# EAGLE design EPGcontrolUniDAC-ClaudeCode (EAGLE 7.7.0)
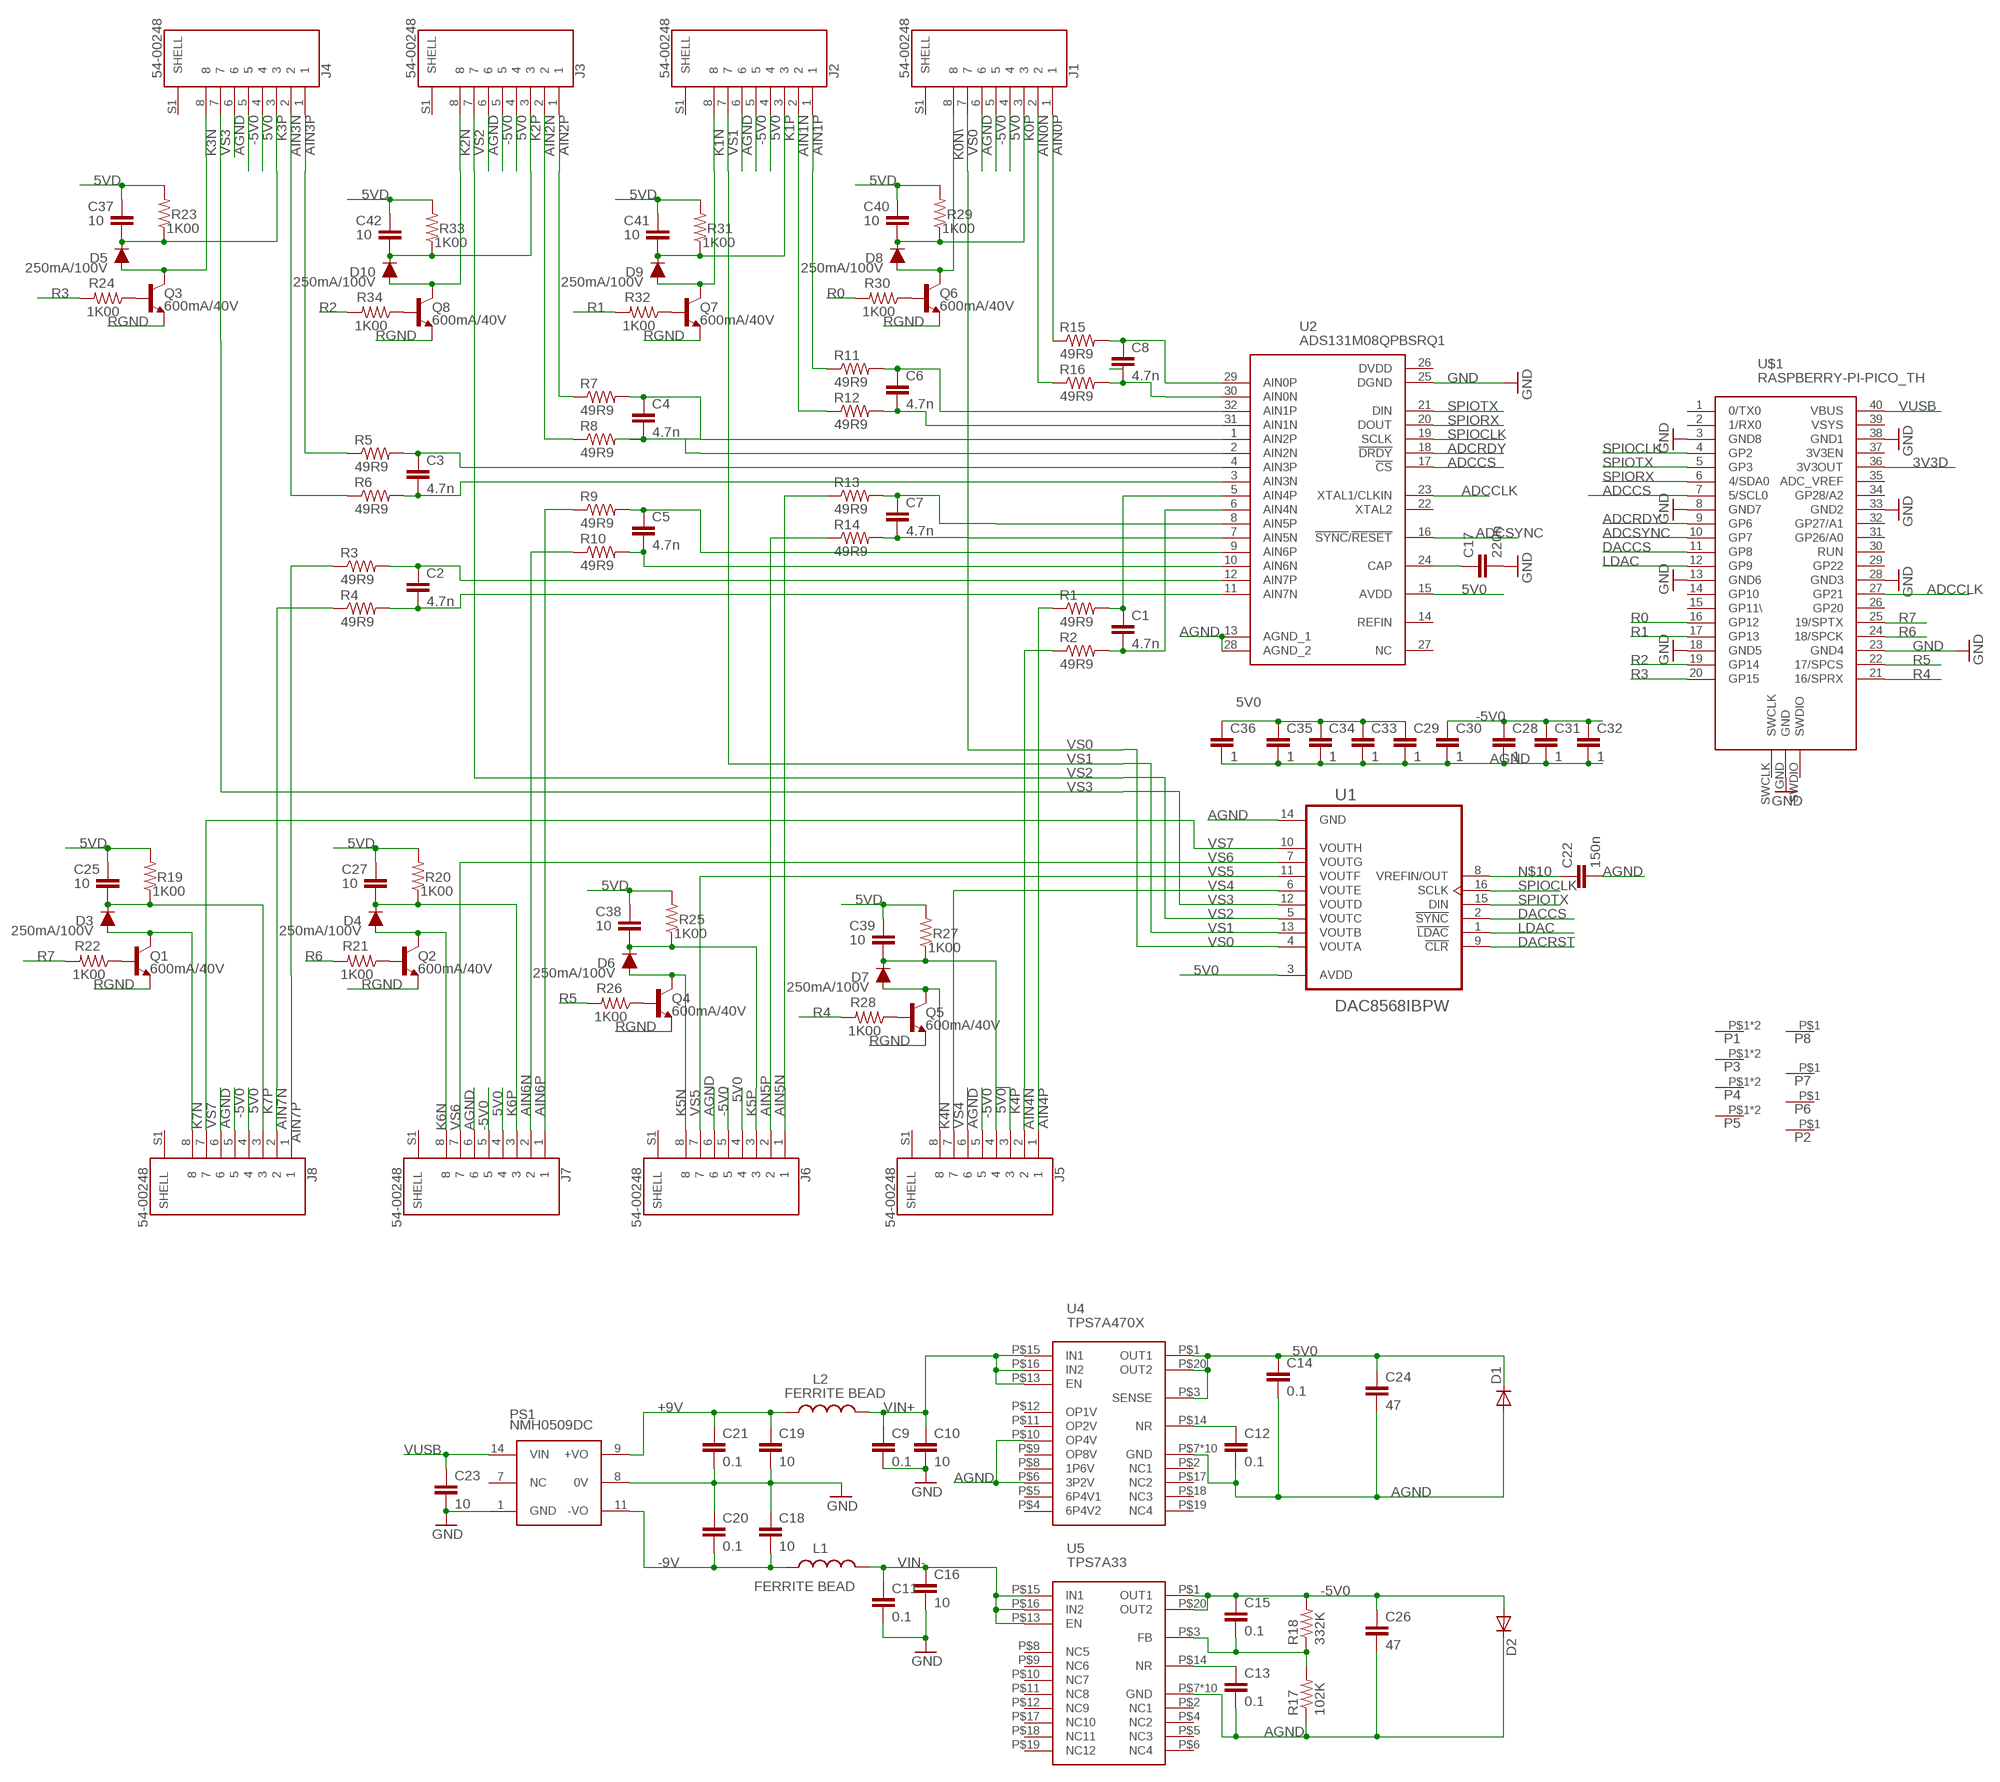
[diagram p0: schematic, sheet 1]

## Parts
C1  4.7n  CAPS0603S  [0603S]
C2  4.7n  CAPS0603S  [0603S]
C3  4.7n  CAPS0603S  [0603S]
C4  4.7n  CAPS0603S  [0603S]
C5  4.7n  CAPS0603S  [0603S]
C6  4.7n  CAPS0603S  [0603S]
C7  4.7n  CAPS0603S  [0603S]
C8  4.7n  CAPS0603S  [0603S]
C9  0.1  CAPS0603S  [0603S]
C10  10  C-EUC1206  [C1206]
C11  0.1  CAPS0603S  [0603S]
C12  0.1  CAPS0603S  [0603S]
C13  0.1  CAPS0603S  [0603S]
C14  0.1  CAPS0603S  [0603S]
C15  0.1  CAPS0603S  [0603S]
C16  10  C-EUC1206  [C1206]
C17  220n  CAPS0603S  [0603S]
C18  10  C-EUC1206  [C1206]
C19  10  C-EUC1206  [C1206]
C20  0.1  CAPS0603S  [0603S]
C21  0.1  CAPS0603S  [0603S]
C22  150n  CAPS0603S  [0603S]
C23  10  C-EUC1206  [C1206]
C24  47  C-EUC1206  [C1206]
C25  10  CAPS1206S  [1206S]
C26  47  C-EUC1206  [C1206]
C27  10  CAPS1206S  [1206S]
C28  1  CAPS0805S  [0805S]
C29  1  CAPS0805S  [0805S]
C30  1  CAPS0805S  [0805S]
C31  1  CAPS0805S  [0805S]
C32  1  CAPS0805S  [0805S]
C33  1  CAPS0805S  [0805S]
C34  1  CAPS0805S  [0805S]
C35  1  CAPS0805S  [0805S]
C36  1  CAPS0805S  [0805S]
C37  10  CAPS1206S  [1206S]
C38  10  CAPS1206S  [1206S]
C39  10  CAPS1206S  [1206S]
C40  10  CAPS1206S  [1206S]
C41  10  CAPS1206S  [1206S]
C42  10  CAPS1206S  [1206S]
D1  DIODESMA  [SMA-DIODE]
D2  DIODESMA  [SMA-DIODE]
D3  250mA/100V  DIODE-BAS16J  [SOD-323]
D4  250mA/100V  DIODE-BAS16J  [SOD-323]
D5  250mA/100V  DIODE-BAS16J  [SOD-323]
D6  250mA/100V  DIODE-BAS16J  [SOD-323]
D7  250mA/100V  DIODE-BAS16J  [SOD-323]
D8  250mA/100V  DIODE-BAS16J  [SOD-323]
D9  250mA/100V  DIODE-BAS16J  [SOD-323]
D10  250mA/100V  DIODE-BAS16J  [SOD-323]
J1  54-00248  [TENSILITY_54-00248]
J2  54-00248  [TENSILITY_54-00248]
J3  54-00248  [TENSILITY_54-00248]
J4  54-00248  [TENSILITY_54-00248]
J5  54-00248  [TENSILITY_54-00248]
J6  54-00248  [TENSILITY_54-00248]
J7  54-00248  [TENSILITY_54-00248]
J8  54-00248  [TENSILITY_54-00248]
L1  FERRITE BEAD  INDUCTOR_SM0805S  [0805S]
L2  FERRITE BEAD  INDUCTOR_SM0805S  [0805S]
P1  CON1BANANA  [BANANA_105-0754-001]
P2  CON1574  [574]
P3  CON1BANANA  [BANANA_105-0754-001]
P4  CON1BANANA  [BANANA_105-0754-001]
P5  CON1BANANA  [BANANA_105-0754-001]
P6  CON1574  [574]
P7  CON1574  [574]
P8  CON1574  [574]
PS1  NMH0509DC  DC-DC-PDS1-DUALPDM2  [PDM2]
Q1  600mA/40V  TRANS_NPN-MMBT2222AL  [SOT23-3]
Q2  600mA/40V  TRANS_NPN-MMBT2222AL  [SOT23-3]
Q3  600mA/40V  TRANS_NPN-MMBT2222AL  [SOT23-3]
Q4  600mA/40V  TRANS_NPN-MMBT2222AL  [SOT23-3]
Q5  600mA/40V  TRANS_NPN-MMBT2222AL  [SOT23-3]
Q6  600mA/40V  TRANS_NPN-MMBT2222AL  [SOT23-3]
Q7  600mA/40V  TRANS_NPN-MMBT2222AL  [SOT23-3]
Q8  600mA/40V  TRANS_NPN-MMBT2222AL  [SOT23-3]
R1  49R9  RESISTOR_SM0805S  [0805S]
R2  49R9  RESISTOR_SM0805S  [0805S]
R3  49R9  RESISTOR_SM0805S  [0805S]
R4  49R9  RESISTOR_SM0805S  [0805S]
R5  49R9  RESISTOR_SM0805S  [0805S]
R6  49R9  RESISTOR_SM0805S  [0805S]
R7  49R9  RESISTOR_SM0805S  [0805S]
R8  49R9  RESISTOR_SM0805S  [0805S]
R9  49R9  RESISTOR_SM0805S  [0805S]
R10  49R9  RESISTOR_SM0805S  [0805S]
R11  49R9  RESISTOR_SM0805S  [0805S]
R12  49R9  RESISTOR_SM0805S  [0805S]
R13  49R9  RESISTOR_SM0805S  [0805S]
R14  49R9  RESISTOR_SM0805S  [0805S]
R15  49R9  RESISTOR_SM0805S  [0805S]
R16  49R9  RESISTOR_SM0805S  [0805S]
R17  102K  R-US_R0805  [R0805]
R18  332K  R-US_R0805  [R0805]
R19  1K00  RESISTOR_SM0805S  [0805S]
R20  1K00  RESISTOR_SM0805S  [0805S]
R21  1K00  RESISTOR_SM0805S  [0805S]
R22  1K00  RESISTOR_SM0805S  [0805S]
R23  1K00  RESISTOR_SM0805S  [0805S]
R24  1K00  RESISTOR_SM0805S  [0805S]
R25  1K00  RESISTOR_SM0805S  [0805S]
R26  1K00  RESISTOR_SM0805S  [0805S]
R27  1K00  RESISTOR_SM0805S  [0805S]
R28  1K00  RESISTOR_SM0805S  [0805S]
R29  1K00  RESISTOR_SM0805S  [0805S]
R30  1K00  RESISTOR_SM0805S  [0805S]
R31  1K00  RESISTOR_SM0805S  [0805S]
R32  1K00  RESISTOR_SM0805S  [0805S]
R33  1K00  RESISTOR_SM0805S  [0805S]
R34  1K00  RESISTOR_SM0805S  [0805S]
U1  DAC8568IBPW  [SOP65P640X120-16N]
U2  ADS131M08QPBSRQ1  [QFP50P700X700X120-32N]
U4  TPS7A470X  [VQFN-20-5X5]
U5  TPS7A33  [VQFN-20-5X5]
U$1  RASPBERRY-PI-PICO_TH  [FT_RASPBERRY-PI-PICO_TH]

## Nets
3V3D: U$1.36(3V3OUT)
5V0: C14.1 C24.1 C29.1 C33.1 C34.1 C35.1 C36.1 D1.C J1.4 J2.4 J3.4 J4.4 J5.4 J6.4 J7.4 J8.4 U1.3(AVDD) U2.15(AVDD) U4.P$1(OUT1) U4.P$3(SENSE) U4.P$20(OUT2)
5VD: C25.1 C27.1 C37.1 C38.1 C39.1 C40.1 C41.1 C42.1 R19.2 R20.2 R23.2 R25.2 R27.2 R29.2 R31.2 R33.2
+9V: C19.1 C21.1 L2.1 PS1.9(+VO)
-5V0: C15.1 C26.1 C28.1 C30.1 C31.1 C32.1 D2.A J1.5 J2.5 J3.5 J4.5 J5.5 J6.5 J7.5 J8.5 R18.2 U5.P$1(OUT1) U5.P$20(OUT2)
-9V: C18.2 C20.2 L1.1 PS1.11(-VO)
A0N: C8.2 R16.2 U2.30(AIN0N)
A0P: C8.1 R15.2 U2.29(AIN0P)
A1N: C6.2 R12.2 U2.31(AIN1N)
A1P: C6.1 R11.2 U2.32(AIN1P)
A2N: C4.2 R8.2 U2.2(AIN2N)
A2P: C4.1 R7.2 U2.1(AIN2P)
A3N: C3.2 R6.2 U2.3(AIN3N)
A3P: C3.1 R5.2 U2.4(AIN3P)
A4N: C1.2 R2.2 U2.6(AIN4N)
A4P: C1.1 R1.2 U2.5(AIN4P)
A5N: C7.2 R14.2 U2.7(AIN5N)
A5P: C7.1 R13.2 U2.8(AIN5P)
A6N: C5.2 R10.2 U2.10(AIN6N)
A6P: C5.1 R9.2 U2.9(AIN6P)
A7N: C2.2 R4.2 U2.11(AIN7N)
A7P: C2.1 R3.2 U2.12(AIN7P)
ADCCLK: U2.23(XTAL1/CLKIN) U$1.27(GP21)
ADCCS: U2.17(!CS) U$1.7(5/SCL0)
ADCRDY: U2.18(!DRDY) U$1.9(GP6)
ADCSYNC: U2.16(!SYNC!/!RESET) U$1.10(GP7)
AGND: C12.2 C13.2 C14.2 C22.2 C24.2 C26.2 C28.2 C29.2 C30.2 C31.2 C32.2 C33.2 C34.2 C35.2 C36.2 D1.A D2.C J1.6 J2.6 J3.6 J4.6 J5.6 J6.6 J7.6 J8.6 R17.1 U1.14(GND) U2.13(AGND_1) U2.28(AGND_2) U4.P$6(3P2V) U4.P$7(GND) U4.P$10(OP4V) U4.PAD1(GND) U4.PAD2(GND) U4.PAD3(GND) U4.PAD4(GND) U4.PAD5(GND) U4.PAD6(GND) U4.PAD7(GND) U4.PAD8(GND) U4.PAD9(GND) U5.P$7(GND) U5.PAD1(GND) U5.PAD2(GND) U5.PAD3(GND) U5.PAD4(GND) U5.PAD5(GND) U5.PAD6(GND) U5.PAD7(GND) U5.PAD8(GND) U5.PAD9(GND)
AIN0N: J1.2 R16.1
AIN0P: J1.1 R15.1
AIN1N: J2.2 R12.1
AIN1P: J2.1 R11.1
AIN2N: J3.2 R8.1
AIN2P: J3.1 R7.1
AIN3N: J4.2 R6.1
AIN3P: J4.1 R5.1
AIN4N: J5.2 R2.1
AIN4P: J5.1 R1.1
AIN5N: J6.1 R13.1
AIN5P: J6.2 R14.1
AIN6N: J7.2 R10.1
AIN6P: J7.1 R9.1
AIN7N: J8.2 R4.1
AIN7P: J8.1 R3.1
DACCS: U1.2(!SYNC) U$1.11(GP8)
DACRST: U1.9(!CLR)
GND: C9.2 C10.2 C11.2 C16.2 C17.2 C18.1 C19.2 C20.1 C21.2 C23.2 PS1.1(GND) PS1.8(0V) U2.25(DGND) U$1.3(GND8) U$1.8(GND7) U$1.13(GND6) U$1.18(GND5) U$1.23(GND4) U$1.28(GND3) U$1.33(GND2) U$1.38(GND1) U$1.GND
K0N\: D8.A J1.8 Q6.3(C)
K0P: C40.2 D8.C J1.3 R29.1
K1N: D9.A J2.8 Q7.3(C)
K1P: C41.2 D9.C J2.3 R31.1
K2N: D10.A J3.8 Q8.3(C)
K2P: C42.2 D10.C J3.3 R33.1
K3N: D5.A J4.8 Q3.3(C)
K3P: C37.2 D5.C J4.3 R23.1
K4N: D7.A J5.8 Q5.3(C)
K4P: C39.2 D7.C J5.3 R27.1
K5N: D6.A J6.8 Q4.3(C)
K5P: C38.2 D6.C J6.3 R25.1
K6N: D4.A J7.8 Q2.3(C)
K6P: C27.2 D4.C J7.3 R20.1
K7N: D3.A J8.8 Q1.3(C)
K7P: C25.2 D3.C J8.3 R19.1
LDAC: U1.1(!LDAC) U$1.12(GP9)
N$1: C15.2 R17.2 R18.1 U5.P$3(FB)
N$2: C17.1 U2.24(CAP)
N$3: Q2.1(B) R21.1
N$4: Q1.1(B) R22.1
N$5: Q3.1(B) R24.1
N$6: Q4.1(B) R26.1
N$7: Q5.1(B) R28.1
N$8: Q6.1(B) R30.1
N$9: Q7.1(B) R32.1
N$10: C22.1 U1.8(VREFIN/OUT)
N$11: Q8.1(B) R34.1
N$18: C13.1 U5.P$14(NR)
N$23: C12.1 U4.P$14(NR)
R0: R30.2 U$1.16(GP12)
R1: R32.2 U$1.17(GP13)
R2: R34.2 U$1.19(GP14)
R3: R24.2 U$1.20(GP15)
R4: R28.2 U$1.21(16/SPRX)
R5: R26.2 U$1.22(17/SPCS)
R6: R21.2 U$1.24(18/SPCK)
R7: R22.2 U$1.25(19/SPTX)
RGND: Q1.2(E) Q2.2(E) Q3.2(E) Q4.2(E) Q5.2(E) Q6.2(E) Q7.2(E) Q8.2(E)
SPIOCLK: U1.16(SCLK) U2.19(SCLK) U$1.4(GP2)
SPIORX: U2.20(DOUT) U$1.6(4/SDA0)
SPIOTX: U1.15(DIN) U2.21(DIN) U$1.5(GP3)
VIN+: C9.1 C10.1 L2.2 U4.P$13(EN) U4.P$15(IN1) U4.P$16(IN2)
VIN-: C11.1 C16.1 L1.2 U5.P$13(EN) U5.P$15(IN1) U5.P$16(IN2)
VS0: J1.7 U1.4(VOUTA)
VS1: J2.7 U1.13(VOUTB)
VS2: J3.7 U1.5(VOUTC)
VS3: J4.7 U1.12(VOUTD)
VS4: J5.7 U1.6(VOUTE)
VS5: J6.7 U1.11(VOUTF)
VS6: J7.7 U1.7(VOUTG)
VS7: J8.7 U1.10(VOUTH)
VUSB: C23.1 PS1.14(VIN) U$1.40(VBUS)
Unconnected: J1.S1(SHELL) J2.S1(SHELL) J3.S1(SHELL) J4.S1(SHELL) J5.S1(SHELL) J6.S1(SHELL) J7.S1(SHELL) J8.S1(SHELL) P1.P$1 P1.P$2 P2.P$1 P3.P$1 P3.P$2 P4.P$1 P4.P$2 P5.P$1 P5.P$2 P6.P$1 P7.P$1 P8.P$1 PS1.7(NC) U2.14(REFIN) U2.22(XTAL2) U2.26(DVDD) U2.27(NC) U4.P$2(NC1) U4.P$4(6P4V2) U4.P$5(6P4V1) U4.P$8(1P6V) U4.P$9(OP8V) U4.P$11(OP2V) U4.P$12(OP1V) U4.P$17(NC2) U4.P$18(NC3) U4.P$19(NC4) U5.P$2(NC1) U5.P$4(NC2) U5.P$5(NC3) U5.P$6(NC4) U5.P$8(NC5) U5.P$9(NC6) U5.P$10(NC7) U5.P$11(NC8) U5.P$12(NC9) U5.P$17(NC10) U5.P$18(NC11) U5.P$19(NC12) U$1.1(0/TX0) U$1.2(1/RX0) U$1.14(GP10) U$1.15(GP11\) U$1.26(GP20) U$1.29(GP22) U$1.30(RUN) U$1.31(GP26/A0) U$1.32(GP27/A1) U$1.34(GP28/A2) U$1.35(ADC_VREF) U$1.37(3V3EN) U$1.39(VSYS) U$1.SWCLK U$1.SWDIO

## Library data of the parts
C1-C9 C11-C15 C17 C20-C22 C25 C27-C42 = STEVES_BU:CAPS
C10 C16 C18 C19 C23 C24 C26 = rcl:C-EU: CAPACITOR, European symbol
D1 D2 = SparkFun:DIODE: Diode
D3-D10 = SparkFun-DiscreteSemi:DIODE: Diode; PROD_ID: DIO-09646
J1-J8 = 54-00248:54-00248
L1 L2 = STEVES_BU:INDUCTOR_SM
P1-P8 = STEVES_BU:CON1
PS1 = STEVES_BU:DC-DC-PDS1-DUAL
Q1-Q8 = SparkFun-DiscreteSemi:TRANS_NPN: NPN transistor Current controlled devices typically used to amplify current or used as a switch. BC547 - COM-08928 <http://www.sparkfun.com/products/8928> (TO-92 45V 100mA) (1.Collector 2.Base 3.Emitter) 2N3904 - COM-00521 <http://www.sparkfun.com/products/521> (TO-92 40V 200mA) (1.Emitter 2.Base 3.Collector) P2N2222A - COM-12852 <http://www.sparkfun.com/products/12852> (TO-92 40V 600mA) (1.Collector 2.Base 3.Emitter); PROD_ID: TRANS-08049
R1-R16 R19-R34 = STEVES_BU:RESISTOR_SM
R17 R18 = rcl:R-US_: RESISTOR, American symbol
U1 = DAC8568IBPW:DAC8568IBPW
U2 = SamacSys_Parts:ADS131M08QPBSRQ1: Analog to Digital Converters - ADC Automotive, eight-channel, 24-bit, 32-kSPS, simultaneous-sampling, delta-sigma ADC Source: Datasheet <https://www.ti.com/lit/ds/symlink/ads131m08-q1.pdf?HQS=dis-mous-null-mousermode-dsf-pf-null-wwe&ts=1673864581738&ref_url=https%3A%2F%2Fwww.ti.com%2Fgeneral%2Fdocs%2Fsuppproductinfo.tsp%3FdistId%3D26%26gotoUrl%3Dhttps%3A%2F%2Fwww.>; ARROW_PART_NUMBER: ADS131M08QPBSRQ1; ARROW_PRICE-STOCK: https://www.arrow.com/en/products/ads131m08qpbsrq1/texas-instruments.html?utm_currency=USD&region=nac; DESCRIPTION: Analog to Digital Converters - ADC Automotive, eight-channel, 24-bit, 32-kSPS, simultaneous-sampling, delta-sigma ADC; HEIGHT: 1.2mm; MANUFACTURER_NAME: Texas Instruments; MANUFACTURER_PART_NUMBER: ADS131M08QPBSRQ1; MOUSER_PART_NUMBER: 595-ADS131M08QPBSRQ1; MOUSER_PRICE-STOCK: https://www.mouser.co.uk/ProductDetail/Texas-Instruments/ADS131M08QPBSRQ1?qs=By6Nw2ByBD1kYCTLuI53zA%3D%3D
U4 = STEVES_BU:TPS7A470X
U5 = STEVES_BU:TPS7A33: TPS7A33 –36-V, 1-A, Ultralow-Noise Negative Voltage Regulator
U$1 = pipico:RASPBERRY-PI-PICO_TH: Raspberry Pi Pico microcontroller board for through-hole mounting.

## Board
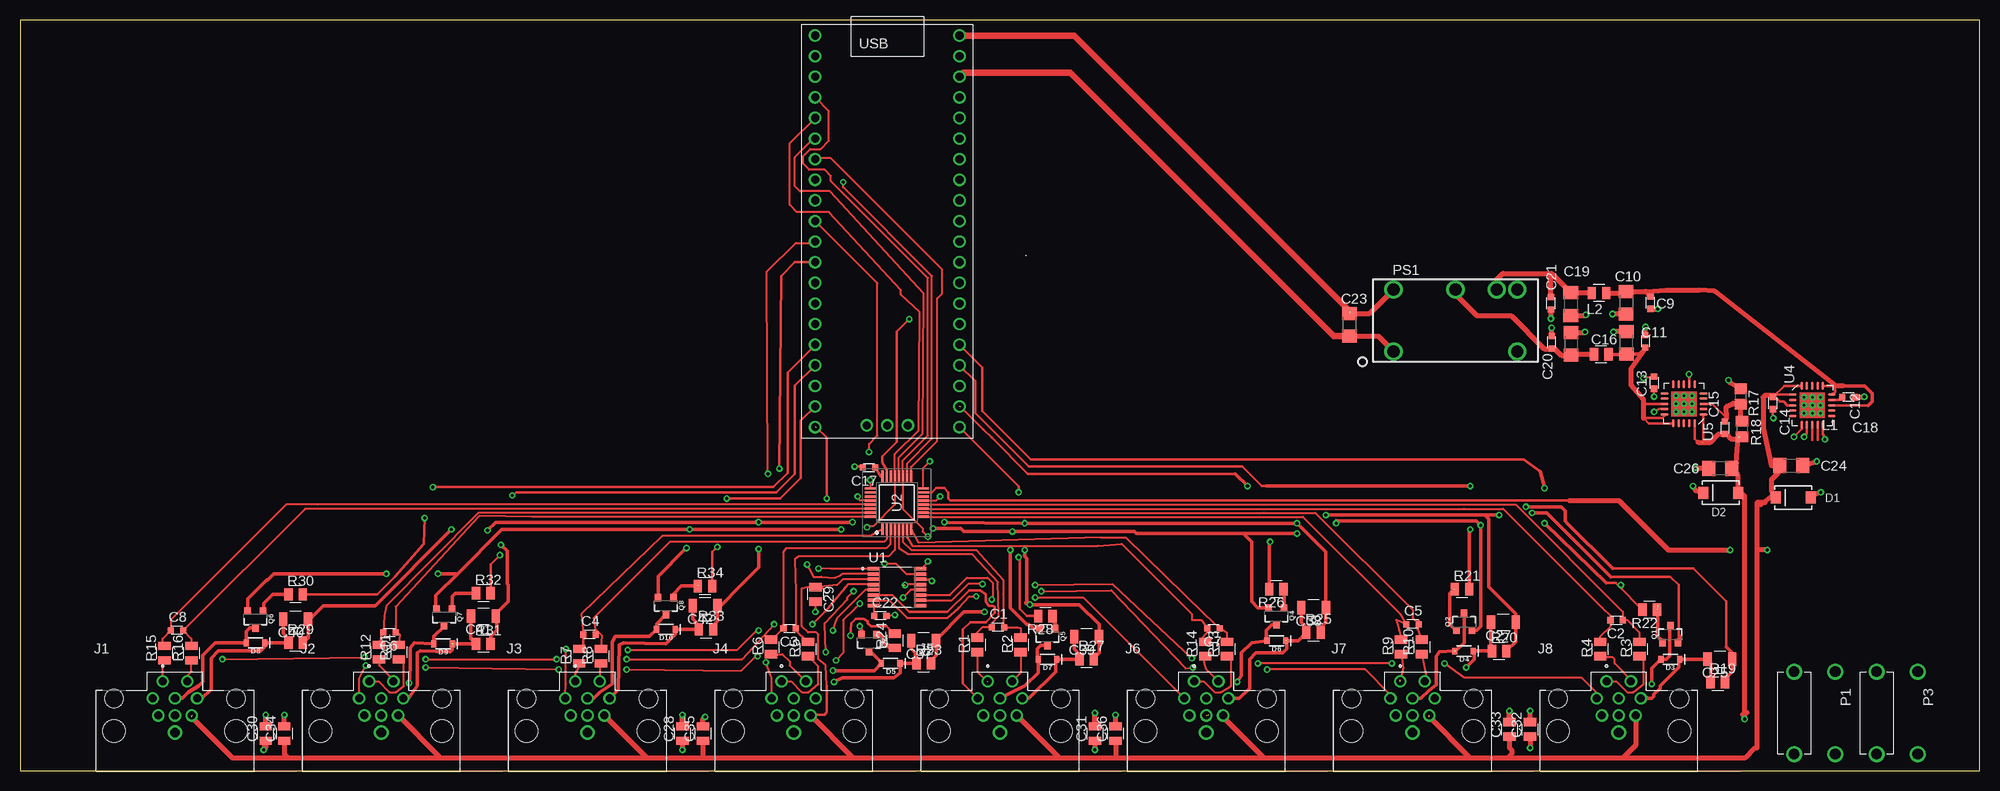
[diagram p1: board, top side]
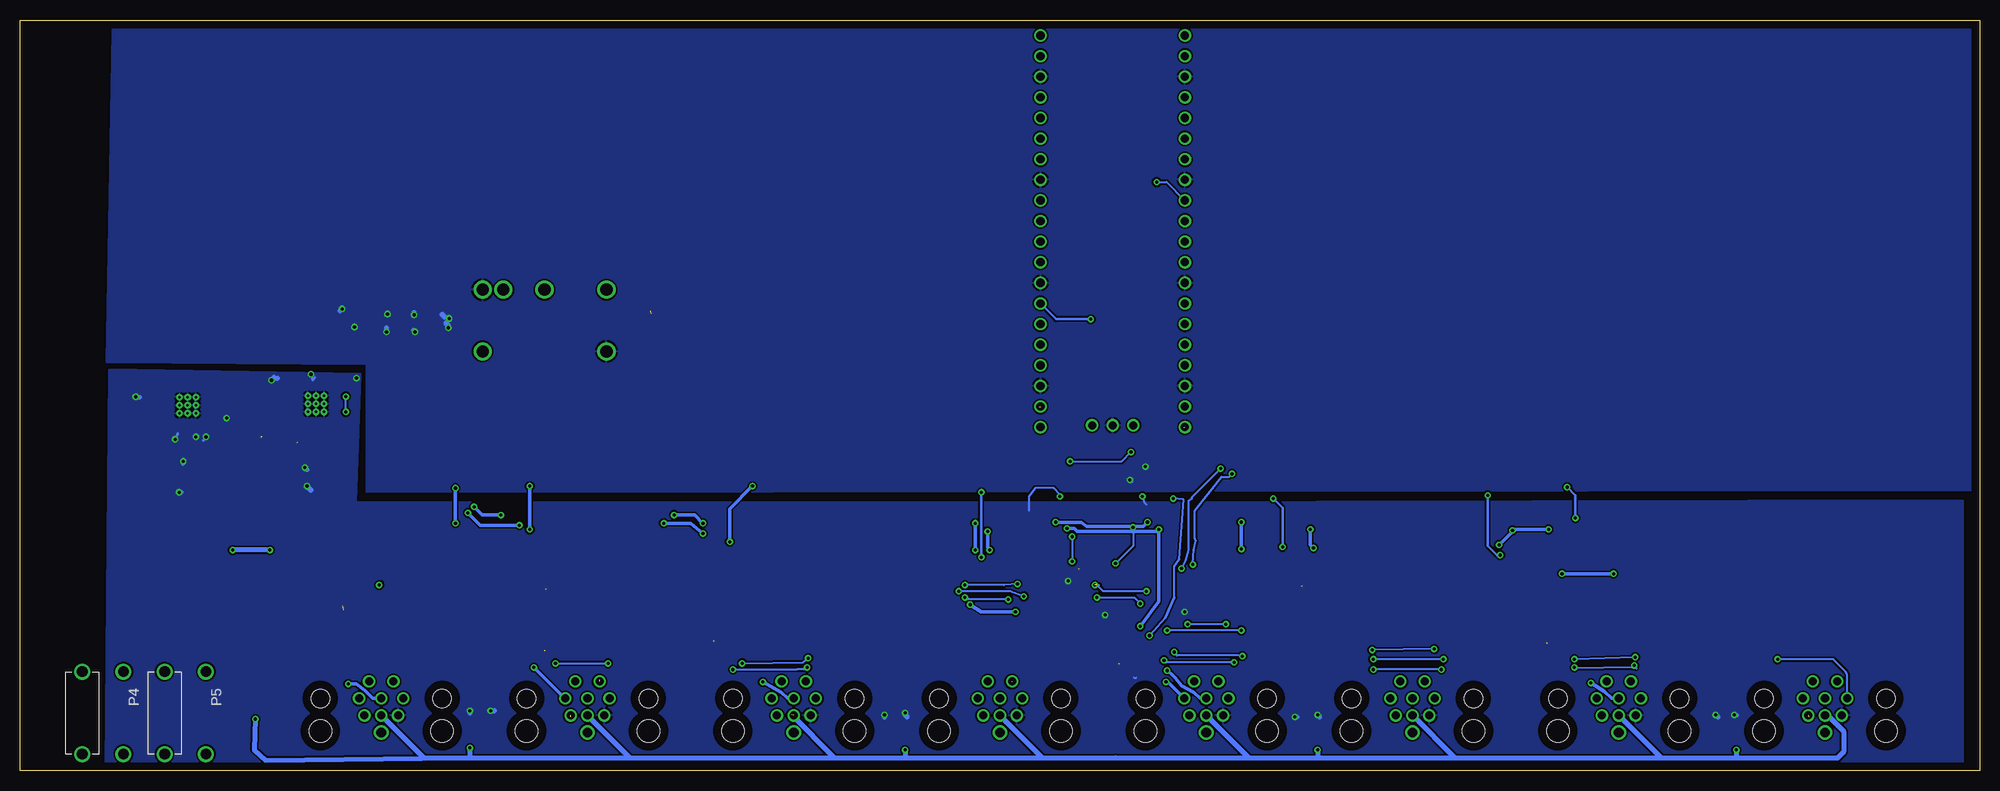
[diagram p2: board, bottom side, seen from below]

Size 241.3 x 92.46 mm. Coordinates in mm from the lower left corner, seen from the top.
Outline: 0,0 241.3,0 241.3,92.46 0,92.46 0,0
Copper layers (1*16): Top 0.035mm / dielectric 1.5mm / Bottom 0.035mm
Design rules "default": minimum track width 10mil, minimum drill 24mil, track to track 8mil, track to pad 8mil, pad to pad 8mil, via to via 8mil, smd to smd 8mil, copper to edge 40mil, drill to drill 8mil, minimum pad ring 10mil, minimum via ring 8mil, stop-mask expansion 4mil, vias tented up to drill 0mil, thermal gap 10mil

### Footprints (pad centres in the part's own frame; a part is rotated, then mirrored left to right if it is on the bottom)
0603S = smd 0.762 x 0.762: 1 -0.762,0; 2 0.762,0
C1206 = smd 1.6 x 1.8: 1 -1.4,0; 2 1.4,0
1206S = smd 1.016 x 1.651: 1 -1.524,0; 2 1.524,0
0805S = smd 1.016 x 1.524: 1 -0.889,0; 2 0.889,0
SMA-DIODE = smd 1.27 x 1.47: A -2.15,0; C 2.15,0
SOD-323 = smd 0.63 x 0.83: A 1.15,0; C -1.15,0
TENSILITY_54-00248 = drill 1 pad 1.4: 1 -1.5,2.1; 2 1.5,2.1; 3 2.725,0; 4 2.075,-2.1; 5 0,-2.1; 6 -2.075,-2.1; 7 -2.725,0; 8 0,0 | drill 1.2 pad 1.7: S1 0,-4.191 | hole 2.3: -7.5,0; 7.5,0 | hole 2.8: -7.5,-4; 7.5,-4
BANANA_105-0754-001 = drill 1.321: P$1 0,0; P$2 -10.16,0
574 = drill 5.41: P$1 0,0
PDM2 = drill 1.5: 1 -7.62,-3.81; 7 7.62,-3.81; 8 7.62,3.81; 9 5.08,3.81; 11 0,3.81; 14 -7.62,3.81
SOT23-3 = smd 0.8 x 0.9: 1 -0.95,-1; 2 0.95,-1; 3 0,1.1
R0805 = smd 1.3 x 1.5: 1 -0.95,0; 2 0.95,0
SOP65P640X120-16N = smd 1.57 x 0.41: 1 -2.87,2.275; 2 -2.87,1.625; 3 -2.87,0.975; 4 -2.87,0.325; 5 -2.87,-0.325; 6 -2.87,-0.975; 7 -2.87,-1.625; 8 -2.87,-2.275; 9 2.87,-2.275; 10 2.87,-1.625; 11 2.87,-0.975; 12 2.87,-0.325; 13 2.87,0.325; 14 2.87,0.975; 15 2.87,1.625; 16 2.87,2.275
QFP50P700X700X120-32N = smd 1.45 x 0.3: 1 -3.225,1.75; 2 -3.225,1.25; 3 -3.225,0.75; 4 -3.225,0.25; 5 -3.225,-0.25; 6 -3.225,-0.75; 7 -3.225,-1.25; 8 -3.225,-1.75; 17 3.225,-1.75; 18 3.225,-1.25; 19 3.225,-0.75; 20 3.225,-0.25; 21 3.225,0.25; 22 3.225,0.75; 23 3.225,1.25; 24 3.225,1.75 | smd 0.3 x 1.45: 9 -1.75,-3.225; 10 -1.25,-3.225; 11 -0.75,-3.225; 12 -0.25,-3.225; 13 0.25,-3.225; 14 0.75,-3.225; 15 1.25,-3.225; 16 1.75,-3.225; 25 1.75,3.225; 26 1.25,3.225; 27 0.75,3.225; 28 0.25,3.225; 29 -0.25,3.225; 30 -0.75,3.225; 31 -1.25,3.225; 32 -1.75,3.225
VQFN-20-5X5 = smd 0.95 x 0.3: P$1 -2.4,1.3; P$2 -2.4,0.65; P$3 -2.4,0; P$4 -2.4,-0.65; P$5 -2.4,-1.3; P$11 2.4,-1.3; P$12 2.4,-0.65; P$13 2.4,0; P$14 2.4,0.65; P$15 2.4,1.3 | smd 0.3 x 0.95: P$6 -1.3,-2.4; P$7 -0.65,-2.4; P$8 0,-2.4; P$9 0.65,-2.4; P$10 1.3,-2.4; P$16 1.3,2.4; P$17 0.65,2.4; P$18 0,2.4; P$19 -0.65,2.4; P$20 -1.3,2.4 | drill 0.305: PAD1 -1,1; PAD2 0,1; PAD3 1,1; PAD4 -1,0; PAD5 0,0; PAD6 1,0; PAD7 -1,-1; PAD8 0,-1; PAD9 1,-1
FT_RASPBERRY-PI-PICO_TH = drill 1: 1 -8.55,24.03; 2 -8.55,21.49; 3 -8.55,18.95; 4 -8.55,16.41; 5 -8.55,13.87; 6 -8.55,11.33; 7 -8.55,8.79; 8 -8.55,6.25; 9 -8.55,3.71; 10 -8.55,1.17; 11 -8.55,-1.37; 12 -8.55,-3.91; 13 -8.55,-6.45; 14 -8.55,-8.99; 15 -8.55,-11.53; 16 -8.55,-14.07; 17 -8.55,-16.61; 18 -8.55,-19.15; 19 -8.55,-21.69; 20 -8.55,-24.23; 21 9.23,-24.23; 22 9.23,-21.69; 23 9.23,-19.15; 24 9.23,-16.61; 25 9.23,-14.07; 26 9.23,-11.53; 27 9.23,-8.99; 28 9.23,-6.45; 29 9.23,-3.91; 30 9.23,-1.37; 31 9.23,1.17; 32 9.23,3.71; 33 9.23,6.25; 34 9.23,8.79; 35 9.23,11.33; 36 9.23,13.87; 37 9.23,16.41; 38 9.23,18.95; 39 9.23,21.49; 40 9.23,24.03; GND 0.34,-24; SWCLK -2.2,-24; SWDIO 2.88,-24

### Placement (x,y rotation side)
C1  120.4,17.65 0 top
C2  196.6,18.54 180 top
C3  94.74,17.53 180 top
C4  70.1,16.76 0 top
C5  171.45,18.03 0 top
C6  45.47,17.02 180 top
C7  146.94,17.53 180 top
C8  19.3,17.27 0 top
C9  200.76,57.66 270 top
C10  197.76,57.63 270 top
C11  200.12,52.89 90 top
C12  225.15,46 0 top
C13  201.19,47.81 90 top
C14  215.84,45.28 270 top
C15  209.91,42.26 90 top
C16  197.8,52.7 90 top
C17  104.52,37.34 180 top
C18  190.97,52.6 270 top
C19  190.94,57.5 270 top
C20  188.59,52.78 270 top
C21  188.5,57.58 270 top
C22  105.92,19.05 0 top
C23  163.67,54.92 270 top
C24  218.1,37.6 0 top
C25  209.3,13.72 180 top
C26  209.35,37.23 180 top
C27  182.63,18.29 180 top
C28  81.53,4.57 90 top
C29  97.92,21.72 270 top
C30  30.23,4.57 90 top
C31  132.33,4.57 90 top
C32  185.93,5.08 90 top
C33  183.39,5.08 90 top
C34  32.51,4.57 90 top
C35  84.07,4.57 90 top
C36  134.87,4.57 90 top
C37  111.25,16 180 top
C38  159.26,20.07 180 top
C39  131.32,16.51 180 top
C40  33.91,18.67 180 top
C41  57.02,19.05 180 top
C42  84.33,20.32 180 top
D1  218.34,33.63 180 top
D2  209.4,34.23 180 top
D3  203.2,13.72 180 top
D4  177.8,14.73 180 top
D5  107.19,13.21 180 top
D6  154.69,16 180 top
D7  126.49,13.72 180 top
D8  28.96,15.75 180 top
D9  52.07,15.62 180 top
D10  79.5,17.4 180 top
J1  19.05,8.89 0 top
J2  44.45,8.89 0 top
J3  69.85,8.89 0 top
J4  95.25,8.89 0 top
J5  120.65,8.89 0 top
J6  146.05,8.89 0 top
J7  171.45,8.89 0 top
J8  196.85,8.89 0 top
L1  194.69,51.3 0 top
L2  194.41,58.85 0 top
P1  218.44,2.03 270 top
P2  218.69,-22.86 0 top  (outside the outline)
P3  228.6,2.03 270 top
P4  233.68,2.03 270 bottom
P5  223.52,2.03 270 bottom
P6  234.19,-22.86 0 top  (outside the outline)
P7  218.69,-39.88 0 top  (outside the outline)
P8  234.7,-40.89 0 top  (outside the outline)
PS1  176.74,55.46 0 top
Q1  203.2,16.76 0 top
Q2  177.8,18.29 0 top
Q3  104.52,15.75 180 top
Q4  154.69,19.05 180 top
Q5  126.49,16.51 180 top
Q6  28.96,18.67 180 top
Q7  52.2,18.92 180 top
Q8  79.5,20.32 180 top
R1  117.86,15.49 90 top
R2  123.19,15.49 90 top
R3  199.39,14.99 90 top
R4  194.56,14.99 90 top
R5  97.03,14.99 90 top
R6  92.46,15.24 90 top
R7  68.83,14.1 90 top
R8  71.5,14.1 90 top
R9  170.05,15.24 90 top
R10  172.59,15.24 90 top
R11  46.61,14.61 90 top
R12  44.2,14.61 90 top
R13  148.59,14.99 90 top
R14  145.92,14.99 90 top
R15  17.78,14.48 90 top
R16  21.08,14.48 90 top
R17  211.86,46.1 270 top
R18  212.02,42.1 270 top
R19  209.04,10.92 0 top
R20  182.12,14.73 0 top
R21  177.55,22.35 0 top
R22  200.66,19.81 180 top
R23  111.25,13.21 0 top
R24  107.7,16 90 top
R25  159.26,17.02 0 top
R26  154.69,22.35 180 top
R27  131.32,13.72 0 top
R28  126.24,19.05 180 top
R29  33.91,15.75 0 top
R30  33.91,21.72 0 top
R31  57.02,15.62 0 top
R32  57.02,21.84 0 top
R33  84.45,17.4 0 top
R34  84.33,22.73 0 top
U1  107.95,22.61 0 top
U2  107.95,33.02 90 top
U4  220.68,45.02 0 top
U5  204.88,45.19 180 top
U$1  106.43,66.55 0 top

### Tracks (layer width: path | path; a pad name or v marks a point on that pad's centre or on a via)
5V0  (via drill 0.38)  (2 unrouted)
  Top 0.254: U1.3 101.31,23.58 100.58,22.86 98.42,22.61 98.81,22.48 C29.1 97.79,22.48 97.66,22.61 96.9,22.61 96.27,22.48 96.27,17.78 97.03,17.02 98.04,17.02 98.3,16.76 98.3,13.72 99.19,12.95 99.31,10.41
  Top 0.305: U4.P$1 216.12,46.32 C14.1 | U4.P$20 217.22,47.42 C14.1 | U4.P$3 217.62,45.02 217.17,45.47 216.66,45.47 215.9,46.23 215.9,46.1 C14.1 | U2.15 112.25,34.27 112.78,34.8 113.79,34.8 114.3,34.29 114.3,33.53 114.55,33.27 190.75,33.27 | 214.88,33.02 215.65,33.78 | 99.31,10.41 99.31,7.24 99.06,6.86 97.39,6.86 J4.4
  Top 0.61: J8.4 198.93,3.09 197.36,1.52 | 197.36,1.52 183.39,1.52 | 183.39,1.52 178.56,1.52 | 178.56,1.52 173.48,6.6 | 178.56,1.52 153.16,1.52 | 153.16,1.52 148.08,6.6 148.08,6.75 J6.4 | 153.16,1.52 134.87,1.52 | 134.87,1.52 127.99,1.52 | 127.99,1.52 J5.4 | 127.99,1.52 102.59,1.52 | 102.59,1.52 J4.4 | 102.59,1.52 84.07,1.52 | 84.07,1.52 77.19,1.52 | 77.19,1.52 J3.4 | 77.19,1.52 51.79,1.52 | 51.79,1.52 J2.4 | 51.79,1.52 32.77,1.52 | 32.77,1.52 26.16,1.52 21.08,6.6 | 216.11,33.75 215.65,34.44 215.65,35.81 216.44,36.61 C24.1 216.69,37.59 215.65,37.59 214.63,42.16 214.63,45.97 214.88,46.23 215.9,46.23 | 216.11,33.75 D1.C | 214.38,32.77 215.65,33.78 216.15,33.71 216.11,33.75 | 214.88,33.02 213.87,33.02 213.87,27.18 | 213.87,27.18 213.87,2.79 213.61,2.79 212.34,1.52 197.36,1.52 | C34.1 32.51,2.03 32.77,1.78 32.77,1.52 | C35.1 84.07,1.52 | C36.1 134.87,1.52 | C33.1 183.39,2.79 183.64,2.54 183.64,2.03 183.39,1.78 183.39,1.52 | 190.75,33.27 196.85,33.27 202.95,27.18 v210.57,27.18 | v215.14,27.18 213.87,27.18
  Bottom 0.61: v210.57,27.18 v215.14,27.18
5VD  (via drill 0.38)
  Top 0.305: 196.09,24.89 205.99,24.89 210.06,20.83 210.06,15.24 210.19,15.11
  Top 0.406: R20.2 184.15,15.88 C27.1 184.15,19.3 180.85,22.61 180.85,30.73 180.85,30.99 180.34,31.5 180.09,31.5 | R19.2 209.93,11.3 210.82,12.19 C25.1 210.82,14.48 210.19,15.11 210.06,15.24 | 196.09,24.89 190.5,30.48 190.25,30.73 190.25,32 189.74,32.51 v185.42,32.51 | R25.2 160.15,17.65 160.78,18.29 C38.1 160.78,23.37 160.78,26.92 v157.23,30.48 148.84,30.48 v123.7,30.48 v113.79,30.61 | 180.09,31.5 162.31,31.5 v160.78,31.5 | 180.09,31.5 v182.12,31.5 | R27.2 132.21,13.84 132.84,14.48 C39.1 132.84,18.03 130.43,20.45 v124.33,20.45 | v124.33,20.45 123.95,20.83 | 123.95,20.83 123.95,23.88 123.95,26.16 123.7,26.42 v123.7,27.18 | R23.2 112.14,13.59 112.78,14.22 112.78,15.75 112.97,15.94 | 112.97,15.94 113.03,16 C37.1 | v102.49,30.61 95.63,30.61 91.06,30.61 | v124.33,20.45 123.83,20.57 123.83,20.7 123.95,20.83 | R33.2 85.34,17.91 85.85,18.41 C42.1 86.23,20.32 88.65,22.73 90.93,25.02 v90.93,27.3 | v90.93,30.61 91.06,30.61 | R31.2 57.91,16.51 58.67,17.27 58.67,19.18 C41.1 58.55,19.3 60.07,20.83 60.07,22.86 60.01,22.92 | 60.01,22.92 59.94,22.99 | R29.2 35.43,16.38 C40.1 35.69,18.67 37.34,20.32 43.69,20.32 v53.09,29.72 | 91.06,30.61 58.55,30.61 v57.53,29.59 | v59.18,27.81 59.94,27.05 59.94,22.99 | 59.94,22.99 60.01,22.92 | v118.75,19.56 116.2,19.56 112.78,16.13 112.97,15.94
  Bottom 0.406: v157.23,30.48 158.24,31.5 v160.78,31.5 | v182.12,31.5 184.4,31.5 v185.42,32.51 | v123.7,30.48 v123.7,27.18 | v113.79,30.61 110.62,30.61 109.98,30.1 103,30.1 102.87,30.23 v102.49,30.61 | v124.33,20.45 122.94,19.56 v118.75,19.56 | v90.93,27.3 v90.93,30.61 | v59.18,27.81 57.53,29.46 v57.53,29.59 57.4,29.72 v53.09,29.72
+9V
  Top 0.61: PS1.9 181.82,60.48 182.59,61.25 188.19,61.25 | 188.19,61.25 188.58,61.25 C19.1 190.98,58.85 L2.1 | C21.1 188.5,60.95 188.19,61.25
-5V0  (via drill 0.38)  (4 unrouted)
  Top 0.28: U5.P$1 207.28,40.37 | U5.P$20 206.18,41.17 | 211.66,41.06 R18.2
  Top 0.305: 212.62,7.13 v212.34,6.35 | 206.18,41.17 206.18,40.88 206.61,40.45
  Top 0.406: 30.23,2.79 v29.97,2.54 29.97,3.05 30.48,3.56
  Top 0.61: 206.61,40.45 207.14,40.42 | R18.2 211.76,40.89 210.66,40.89 210.06,41.5 C15.1 209.8,41.4 209.04,41.4 208.03,40.39 207.26,40.39 | 211.58,34.21 D2.A | D2.A 211.55,36.43 C26.1 210.75,37.27 211.33,37.85 211.58,41.15 | 212.62,7.13 212.11,6.88 212.34,6.6 212.34,33.78 211.84,34.29 211.61,34.29 D2.A | C30.1 30.23,2.79 v29.97,2.54 | C28.1 v81.53,2.54 | C31.1 v132.33,2.54 | C32.1 v185.93,2.79
  Bottom 0.254: 106.43,1.78 106.43,1.52
  Bottom 0.406: 39.18,1.52 30.23,1.52 29.97,1.78
  Bottom 0.61: J1.5 18.73,6.79 16.76,4.83 16.76,2.29 17.53,1.52 39.18,1.52 | 39.18,1.52 J2.5 | 39.18,1.52 64.58,1.52 | 64.58,1.52 J3.5 | 64.58,1.52 81.53,1.52 | 81.53,1.52 89.98,1.52 | 89.98,1.52 J4.5 | 89.98,1.52 106.43,1.52 115.38,1.52 | 115.38,1.52 J5.5 | 115.38,1.52 132.33,1.52 | 132.33,1.52 140.97,1.52 | 140.97,1.52 146.3,6.86 | 140.97,1.52 166.18,1.52 | 166.18,1.52 J7.5 | 166.18,1.52 185.93,1.52 | 185.93,1.52 191.58,1.52 191.68,1.62 | 191.68,1.62 J8.5 | v212.34,6.35 212.47,2.54 211.07,1.27 191.77,1.52 191.68,1.62 | v29.97,2.54 29.97,1.78 | v81.53,2.54 81.53,1.52 | v132.33,2.54 132.33,1.52 | v185.93,2.79 185.93,1.78 185.93,1.52
-9V
  Top 0.61: PS1.11 176.74,58.7 179.39,56.05 183.59,56.05 187.69,51.95 188.53,51.95 C20.2 188.93,52.02 189.79,51.15 190.92,51.15 C18.2 191.07,51.3 L1.1
A0N
  Top 0.254: U2.30 37.35,32.27 35.06,32.27 C8.2 21.08,16.26 R16.2 | R16.2 21.08,15.24 R16.2
A0P
  Top 0.254: U2.29 36.58,32.77 32.77,32.77 18.54,18.54 C8.1 17.53,16.26 17.53,15.24 17.65,15.37 R15.2
A1N
  Top 0.254: U2.31 62.25,31.77 56.41,31.77 45.09,20.32 44.83,19.05 C6.2 44.45,16.51 R12.2
A1P
  Top 0.254: U2.32 63.02,31.27 56.54,31.4 46.23,20.19 46.23,17.78 C6.1 46.23,17.27 46.74,16.76 R11.2
A2N
  Top 0.254: U2.2 106.7,28.47 106.43,28.19 85.34,28.19 80.01,28.19 70.61,18.8 C4.2 70.99,17.02 70.87,17.4 71.63,16.64 R8.2
A2P
  Top 0.254: U2.1 104.72,28.91 79.07,28.91 69.09,19.3 C4.1
  Top 0.305: C4.1 69.34,15.49 R7.2
A3N
  Top 0.254: U2.3 107.19,29.78 107.19,27.94 106.68,27.43 94.36,27.43 93.96,26.9 93.98,21.84 C3.2 | C3.2 93.98,18.03 C3.2 | R6.2 92.96,16.51 C3.2
A3P
  Top 0.254: U2.4 107.7,27.18 106.93,26.42 95.89,26.42 95.38,26.04 95.5,22.1 95.5,20.83 C3.1 95.5,17.27 96.01,16.76 96.77,16.13 R5.2
A4N
  Top 0.254: U2.6 108.7,28.21 109.73,27.18 117.73,27.18 121.03,23.5 121.03,21.72 121.03,17.91 121.16,17.78 | 121.16,18.03 121.16,17.78 | 121.16,17.78 C1.2 122.81,17.65 123.19,17.53 R2.2
A4P
  Top 0.254: U2.5 108.2,27.44 109.35,26.67 117.22,26.67 117.28,26.61 120.4,23.23 120.52,19.05 119.63,18.16 C1.1 118.49,17.65 117.73,16.89 R1.2
A5N
  Top 0.254: U2.7 109.2,28.72 109.86,27.69 132.72,27.69 135.64,27.94 144.27,19.3 144.27,18.54 145.41,18.54 C7.2 146.3,17.14 145.29,16.13 R14.2
A5P
  Top 0.254: U2.8 110.67,28.07 133.1,28.7 136.14,28.7 145.8,19.3 C7.1 148.21,17.27 148.59,17.02 R13.2 | R13.2 148.59,15.75 R13.2
A6N
  Top 0.254: U2.10 153.14,31.77 159.49,31.77 171.45,19.81 171.45,18.8 171.7,18.54 C5.2 172.21,18.54 172.09,17.4 R10.2
A6P
  Top 0.254: U2.9 152.63,31.27 157.96,31.27 169.93,19.3 C5.1 169.42,18.54 169.8,17.27 R9.2
A7N
  Top 0.254: U2.11 177.79,32.27 182.61,32.27 194.82,20.07 195.83,19.05 C2.2 195.58,18.54 195.83,18.29 195.83,17.78 194.56,16.51 R4.2
A7P
  Top 0.254: U2.12 178.56,32.77 184.15,32.77 197.36,19.56 C2.1 197.87,18.54 199.39,17.02 R3.2
ADCCLK  (via drill 0.38)
  Top 0.305: U2.23 106.7,37.06 106.17,37.97 106.17,38.73 107.95,40.51 107.95,54.1 v109.47,55.63
  Bottom 0.305: v109.47,55.63 113.72,55.63 U$1.27
ADCCS
  Top 0.254: U2.17 109.7,37.44 112.9,40.64 112.9,58.17 113.54,58.8 113.54,61.72 99.82,75.44 97.98,75.44 U$1.7
ADCRDY  (via drill 0.38)
  Top 0.254: U2.18 109.2,37.83 112.27,40.89 112.27,60.96 101.35,71.88 v101.35,72.52
  Bottom 0.254: v101.35,72.52 100.14,72.52 U$1.9
ADCSYNC  (via drill 0.38)
  Top 0.254: U2.16 111.17,37.26 v112.01,38.1 | v104.52,39.24 104.52,40.26 105.54,41.27 105.54,60.06 U$1.10
  Bottom 0.254: v112.01,38.1 105.66,38.1 v104.52,39.24
AGND  (via drill 0.38, 0.4)
  Top 0.254: U2.28 103.38,33.27 v103.12,33.78 | U2.13 112.77,33.27 v113.28,33.78 | C22.2 v107.7,19.18 | U1.14 111.97,23.58 v112.27,23.37 | C29.2 v97.92,19.56
  Top 0.28: U4.P$7 220.03,41.52 v219.68,41.11 | C13.2 | C13.2 v199.89,48.37 | U5.P$7 205.53,48.73 v205.51,48.84 | U4.P$10 221.98,41.57 v222.23,40.81 | U4.P$6 219.38,42.07 v218.43,41.11
  Top 0.305: C14.2 215.84,43.49 v215.9,43.43
  Top 0.61: C12.2 226.37,46.05 v227.08,46.06 | R17.1 210.54,47.82 v210.36,48.09 | C24.2 v221.22,38.11 v221.23,38.1 | D1.A 221.64,34.4 v221.74,34.29 | D2.C 206.3,34.49 v205.99,35.05 | C26.2 206.36,37.23 v206.25,37.34 | C30.2 v30.23,6.86 | C34.2 v32.51,6.86 | C28.2 v81.53,6.86 | C35.2 84.07,6.35 v84.33,6.6 | C31.2 v132.33,7.11 | C36.2 v134.87,6.86 | C32.2 v185.93,7.37 | C33.2 v183.39,7.37
  Bottom 0.254: v103.12,33.78 102.87,33.02 102.62,32.77 | v113.28,33.78 113.28,34.04 114.05,34.8 116.33,34.8 117.09,33.78 117.09,32 | 104.14,11.43 103.89,11.43 | v107.7,19.18 107.7,18.92 | v112.27,23.37 112.27,23.62 | v97.92,19.56 98.04,19.43
  Bottom 0.28: v219.68,41.11 219.78,41.21 | v205.51,48.84 205.31,48.14 205.01,48.44 | v222.23,40.81 221.88,41.56 | v218.43,41.11 218.78,40.66
  Bottom 0.305: v215.9,43.43 215.9,43.18
  Bottom 0.61: v227.08,46.06 226.63,46.01 | v210.36,48.09 210.06,48.44 209.61,48.34 | v221.23,38.1 221.23,37.85 | v221.74,34.29 221.49,34.29 | v205.99,35.05 205.49,34.54 | v206.25,37.34 205.99,37.08 | v30.23,6.86 29.97,6.86 | v32.51,6.86 32.26,6.6 | v81.53,6.86 81.28,6.6 | v84.33,6.6 84.07,6.6 | v132.33,7.11 132.33,6.86 132.08,6.6 | v134.87,6.86 134.87,6.6 | v185.93,7.37 185.93,7.11 | v183.39,7.37 182.88,7.37
  pour Bottom: 108.2,33.02 199.9,33.02 199.39,48.9 230.38,49.4 230.89,-6.86 2.03,-6.86 2.03,33.27
AIN0N
  Top 0.254: J1.2 20.55,11.66 21.08,12.19 R16.1
AIN0P
  Top 0.254: J1.1 17.55,13.36 R15.1
AIN1N
  Top 0.254: J2.2 45.95,11.2 44.2,12.95 44.32,13.34 R12.1
AIN1P
  Top 0.254: J2.1 44.13,10.99 45.47,9.65 46.23,9.65 47.24,10.41 47.24,13.34 R11.1
AIN2N
  Top 0.254: R8.1 71.37,12.54 J3.2
AIN2P
  Top 0.254: J3.1 68.35,11.91 68.96,12.95 R7.1
AIN3N
  Top 0.254: R6.1 93.85,14.35 94.74,13.46 94.74,12.95 96.52,11.18 96.56,11.18 J4.2
AIN3P
  Top 0.254: J4.1 94.93,10.99 96.27,9.65 97.03,9.65 98.3,10.67 98.3,12.83 R5.1
AIN4N
  Top 0.254: R2.1 123.19,12.03 J5.2
AIN4P  (1 unrouted)
  Top 0.254: R1.1 117.86,12.19 119.13,10.92
AIN5N
  Top 0.254: J6.1 145.73,10.99 147.07,9.65 147.83,9.65 149.1,10.41 149.1,13.59 R13.1
AIN5P
  Top 0.254: J6.2 147.51,10.99 146.05,12.45 145.8,13.34 R14.1
AIN6N
  Top 0.254: R10.1 173.23,11.27 J7.2
AIN6P  (1 unrouted)
  Top 0.254: R9.1 170.31,12.57 169.93,11.18 | J7.1 169.95,10.95 169.93,10.92
AIN7N
  Top 0.254: J8.2 198.35,11.2 196.34,13.21 196.34,13.72 196.09,13.97 194.69,13.97 R4.1
AIN7P
  Top 0.254: J8.1 196.53,10.99 197.87,9.65 198.63,9.65 199.9,10.67 199.9,13.59 R3.1
DACCS  (via drill 0.38)
  Top 0.254: v92.08,36.58 91.95,61.47 95.5,65.02 97.72,65.02 U$1.11 | v96.9,25.4 97.66,23.88 98.68,23.88 100.33,23.75 101.09,24.13 101.19,24.23 U1.2
  Bottom 0.254: v96.9,25.4 96.9,25.53 96.77,27.18 96.52,28.32 96.65,28.57 96.65,32 93.34,36.2 92.46,36.2 v92.08,36.58
GND  (via drill 0.38, 0.4)
  Top 0.254: U2.25 104.72,35.74 v104.65,35.81
  Top 0.305: C17.2 103.63,37.47 v102.74,37.47
  Top 0.61: C10.2 196.11,56.23 v196.09,56.25 | C16.2 196.24,54.1 v196.19,54.05 | C18.1 192.63,54 v192.69,54.05 | C19.2 192.73,56.1 v192.79,56.15 | C20.1 v188.59,54.55 | C21.2 188.5,55.71 v188.49,55.7 | C11.2 200.12,54.38 v200.14,54.65 | C9.2 v201.67,56.9 v201.68,56.9 | C23.2 167.24,53.52 PS1.1
  Top 0.813: C23.2 161.74,53.52 129.29,85.98 116.14,85.98 U$1.38
  Bottom 0.254: v104.65,35.81 104.39,35.56
  Bottom 0.305: v102.74,37.47 102.74,37.72 v102.74,37.47
  Bottom 0.61: v196.09,56.25 196.09,56.35 | v196.19,54.05 196.19,54.55 | v192.69,54.05 192.89,54.25 | v192.79,56.15 192.79,56.45 | v188.59,54.55 188.59,54.85 188.89,55.15 | v188.49,55.7 188.99,55.85 189.39,56.25 | v201.68,56.9 201.93,56.64
  pour Bottom: -1.78,34.54 198.63,34.29 198.63,50.04 230.63,50.29 229.87,94.49 -1.78,94.49
K0N\
  Top 0.406: J1.8 19.94,8.89 20.7,9.65 21.97,10.41 22.48,10.92 22.48,14.22 24,15.75 27.56,15.75 | 27.56,15.75 D8.A | Q6.3 28.24,17.57 27.81,17.14 27.81,16 27.56,15.75
K0P
  Top 0.406: J1.3 22.35,8.89 23.5,10.03 23.5,13.84 24.38,14.73 29.59,14.73 30.23,15.37 30.23,15.88 30.23,15.87 D8.C R29.1 33.02,16.26 32.38,16.89 C40.2
K1N  (via drill 0.38)
  Top 0.406: Q7.3 52.28,17.82 52.32,17.78 52.2,17.78 50.93,16.51 D9.A 48.51,15.75 48.01,15.11 48.01,12.7 v47.88,10.79
  Bottom 0.406: J2.8 45.34,8.89 46.23,9.78 v47.88,10.79
K1P  (1 unrouted)
  Top 0.406: 53.34,15.75 53.47,15.62 R31.1 55.5,16.26 C41.2 | D9.C 53.22,14.87 53.09,14.73 52.96,14.61 49.28,14.73 48.9,14.48 48.9,10.41 47.88,9.02 47.3,9.02 J2.3
K2N
  Top 0.406: Q8.3 78.36,18.08 D10.A 77.46,16.51 73.28,16.51 72.9,15.88 72.9,11.18 72.9,10.67 71.37,9.65 70.61,8.89 J3.8
K2P
  Top 0.406: J3.3 72.64,8.89 73.66,10.03 73.79,15.49 74.3,15.75 79.5,15.62 80.64,16.76 D10.C R33.1 83.57,17.91 82.93,18.54 82.8,18.67 C42.2
K3N  (via drill 0.38)  (1 unrouted)
  Top 0.406: v100.08,12.32 105.16,12.32 D5.A | Q3.3 104.73,14.65 106.17,13.21 106.05,13.08
  Bottom 0.406: J4.8 96.01,8.89 96.77,9.65 98.3,10.41 99.06,11.43 99.31,11.68 99.57,11.94 v100.08,12.32
K3P  (via drill 0.38)
  Top 0.406: C37.2 109.73,14.99 110.24,14.48 110.24,13.34 R23.1 108.71,13.21 108.46,12.95 108.46,13.09 D5.C 108.34,12.07 107.57,11.43 101.22,11.43 v100.2,10.92
  Bottom 0.406: v100.2,10.92 100.01,10.92 J4.3
K4N
  Top 0.406: Q5.3 125.65,15.41 125.22,14.99 125.22,13.84 D7.A 125.34,12.06 123.7,10.41 J5.8
K4P
  Top 0.406: J5.3 124.21,8.89 127.51,12.19 127.51,13.58 D7.C R27.1 130.43,14.35 129.79,14.99 C39.2 130.05,16.76
K5N  (via drill 0.38)
  Top 0.406: v149.86,10.92 150.37,11.68 150.37,14.48 151.64,15.75 153.42,16 D6.A 153.42,16.12 153.42,17.27 154.09,17.95 Q4.3
  Bottom 0.406: J6.8 146.81,8.89 147.57,9.65 v149.86,10.92
K5P  (1 unrouted)
  Top 0.406: J6.3 150.11,8.89 151.38,10.16 151.38,13.72 152.15,14.48 155.45,14.48 155.96,14.99 155.96,16 157.35,16 R25.1 158.37,17.65 157.73,18.29 C38.2
K6N  (1 unrouted)
  Top 0.406: J7.8 172.47,8.89 173.48,9.91 174.37,10.54 174.37,14.1 174.75,14.61 D4.A | Q2.3 177.8,15.75 176.78,14.73
K6P  (via drill 0.38)
  Top 0.406: v178.05,12.7 179.07,13.72 179.07,14.48 178.82,14.73 D4.C R20.1 181.1,14.86 C27.2
  Bottom 0.406: J7.3 174.24,8.89 v178.05,12.7
K7N  (via drill 0.38)
  Top 0.406: v200.91,10.67 200.91,12.58 D3.A | D3.A 201.93,13.72 | Q1.3 203.12,17.78 203.12,14.14 202.69,13.72 D3.A
  Bottom 0.406: J8.8 197.87,8.89 198.88,9.91 199.9,10.67 v200.91,10.67
K7P
  Top 0.406: J8.3 200.91,8.89 201.17,9.14 201.17,9.4 201.93,10.16 201.93,10.41 204.22,12.7 204.22,13.58 D3.C 207.52,13.72 207.77,13.97 C25.2 208.15,13.34 R19.1
LDAC  (via drill 0.38)
  Top 0.254: U1.1 99.81,24.88 v98.3,24.89
  Top 0.305: U$1.12 95.4,62.64 93.73,60.96 v93.47,37.21
  Bottom 0.254: v98.3,24.89 97.79,25.91 97.41,27.18 97.41,33.27 97.03,33.53 97.03,33.66 v93.47,37.21
N$1
  Top 0.28: U5.P$3 208.36,45.19 210.12,43.43
  Top 0.61: C15.2 210.04,43.31 210.12,43.43 210.11,44.84 210.94,45.25 R17.2 211.82,43.65 211.79,42.97 R18.1
N$2
  Top 0.305: U2.24 106,36.24 C17.1
N$3  (1 unrouted)
  Top 0.406: Q2.1 176.77,17.29 176.02,18.03 176.02,21.84 176.53,22.35 176.78,22.35
N$4  (1 unrouted)
  Top 0.406: Q1.1 202.25,15.94 201.68,16.51 201.68,20.32
N$5
  Top 0.406: R24.1 107.06,15.11 106.43,15.62 106.05,16.64 105.28,16.64 105.45,16.51 Q3.1
N$6
  Top 0.406: Q4.1 155.64,22.29 R26.1
N$7
  Top 0.406: R28.1 127.13,18.41 127.51,18.03 127.51,17.58 Q5.1
N$8
  Top 0.406: R30.1 31.11,21.72 29.97,20.57 29.97,19.73 Q6.1
N$9
  Top 0.406: R32.1 53.59,21.84 53.21,21.46 53.21,19.99 Q7.1
N$10
  Top 0.254: U1.8 105.08,18.87 105.16,18.8 C22.1
N$11  (1 unrouted)
  Top 0.406: Q8.1 80.45,21.78 81.41,22.73 83.57,22.73
N$16
  Top 0.28: 220.68,42.96 220.68,40.71
N$17
  Top 0.28: 221.33,42.46 221.33,40.71
N$18  (via drill 0.4)
  Top 0.254: U5.P$14 201.81,44.54 v201.21,44.19 | v201.21,46.09 201.21,46.72 C13.1
  Bottom 0.254: v201.21,44.19 v201.21,46.09
N$23
  Top 0.28: 224.18,45.76 224.09,45.76 C12.1 223.9,45.67 U4.P$14
R0  (via drill 0.38)
  Top 0.305: R30.2 43.94,21.72 46.1,23.88 49.66,27.94 v49.78,31.11 | v50.8,34.92 92.71,34.92 94.49,36.7 94.49,49.02 97.79,52.32 97.79,52.39 U$1.16
  Bottom 0.305: v49.78,31.11 49.78,33.91 v50.8,34.92
R1  (via drill 0.38)
  Top 0.305: R32.2 57.91,25.4 v59.05,26.54 | v60.58,33.91 60.71,33.91 61.09,34.29 93.09,34.29 95.38,36.58 95.38,47.44 U$1.17
  Bottom 0.305: v59.05,26.54 59.44,26.54 60.58,27.69 v60.58,33.91
R2  (via drill 0.38)
  Top 0.254: 96.14,43.12 U$1.19
  Top 0.305: R34.2 85.22,26.92 v85.85,27.56 | v87,33.53 93.6,33.53 96.14,36.07 96.14,43.12
  Bottom 0.305: v85.85,27.56 85.85,32.38 v87,33.53
R3  (via drill 0.38)  (1 unrouted)
  Top 0.254: 99.31,40.88 99.31,41.02 98.04,42.29
  Top 0.305: R24.2 107.19,17.27 106.68,17.78 104.78,17.78 104.39,18.16 104.39,18.41 103.89,18.67 102.87,18.67 102.36,18.16 v102.23,16.64 | v99.31,33.53 99.31,40.88
  Bottom 0.254: 99.19,21.34 99.19,25.15 98.55,26.04 98.04,33.4 v99.31,33.53
  Bottom 0.305: v102.23,16.64 100.33,18.8 99.19,21.34
R4  (via drill 0.38)
  Top 0.305: R28.2 123.95,19.05 123.06,19.94 123.06,26.16 v122.94,26.29 | v122.94,34.29 122.94,35.04 U$1.21
  Bottom 0.305: v122.94,26.29 v122.94,34.29
R5  (via drill 0.38)  (1 unrouted)
  Top 0.305: 149.61,36.58 124.08,36.58 119.63,41.02 118.62,42.04 115.82,44.83
  Top 0.406: R26.2 153.8,28.07 v153.92,28.19 | v151.13,35.05 149.61,36.58
  Bottom 0.406: v153.92,28.19 153.92,32.26 v151.13,35.05
R6  (via drill 0.38)
  Top 0.305: 153.42,35.05 152.91,35.05 150.5,37.47 124.21,37.47 117.6,44.07 117.6,47.99 U$1.24
  Top 0.406: R21.2 178.44,29.84 v178.56,29.72 | v178.56,35.05 153.42,35.05
  Bottom 0.406: v178.56,29.72 v178.56,35.05
R7  (via drill 0.38)
  Top 0.254: v197.1,22.86 196.85,22.86 196.79,22.8
  Top 0.305: 195.33,23.11 196.47,23.11 196.79,22.8 R22.2 | 187.2,36.83 185.17,38.35 173.74,38.35 124.46,38.35 118.49,44.32 118.49,49.64 U$1.25
  Top 0.406: R22.2 199.77,20.19 | 195.33,23.11 v187.71,30.48 | v187.71,34.8 187.2,36.83
  Bottom 0.254: 196.85,23.11 v197.1,22.86
  Bottom 0.406: v187.71,30.48 v187.71,34.8 | v187.71,34.8 187.71,35.05 v187.71,34.8
RGND  (via drill 0.38)
  Top 0.305: 195.83,23.88 203.2,23.88 204.22,22.86 204.22,16.51 204.34,16.38
  Top 0.406: Q2.2 179.34,17.29 179.83,17.78 v179.83,30.23 | Q1.2 204.15,16.19 204.34,16.38 204.47,16.51 | 195.83,23.88 188.98,30.73 187.96,31.75 v186.18,31.75 | Q4.2 152.42,20.05 151.64,20.83 151.64,24.13 151.64,28.19 150.62,29.21 | v179.83,30.23 179.32,30.73 | 179.32,30.73 162.05,30.73 v162.05,30.48 | v157.23,29.21 153.67,29.21 150.62,29.21 | 150.62,29.21 148.59,29.21 137.41,29.21 137.16,29.46 v122.17,29.46 116.2,29.46 115.82,29.84 v112.39,29.84 | 179.32,30.73 v179.83,30.23 | Q5.2 124.73,17.51 124.21,18.03 123.95,18.03 121.92,20.07 121.92,26.67 v121.92,27.18 | Q3.2 103.7,17.08 v103.38,17.78 | v101.09,29.72 99.44,29.72 v82.42,29.72 59.31,29.72 53.91,24.32 | Q8.2 78.55,23.94 81.79,27.18 v82.04,27.43 | Q6.2 28.01,21.15 30.35,23.5 30.48,23.5 31.24,24.26 v45.09,24.26 | 53.91,24.32 51.18,21.59 51.18,19.99 Q7.2 | v51.44,24.26 53.85,24.26 53.91,24.32
  Bottom 0.406: v162.05,30.48 158.75,30.48 v157.23,29.21 | v179.83,30.23 184.66,30.23 v186.18,31.75 | v122.17,29.46 122.17,27.43 v121.92,27.18 | v103.38,17.78 101.09,20.83 v101.09,29.72 101.35,29.46 111.12,29.46 111.51,29.84 v112.39,29.84 | v82.42,29.72 82.42,27.81 v82.04,27.43 | v45.09,24.26 v51.44,24.26
SPIOCLK  (via drill 0.38)  (1 unrouted)
  Top 0.254: v111.76,28.83 111.12,29.46 111.12,29.84 108.7,32.27 U2.19 108.7,38.22 111.76,41.27 111.76,60.71 99.82,72.64 99.82,73.28 99.06,74.04 97.16,74.04 96.39,74.8 96.39,75.69 97.28,76.58 98.55,76.58 99.57,77.6 99.57,81.27 U$1.4 | v111.76,25.78 111.76,25.65 111,24.89
  Bottom 0.254: v111.76,28.83 v111.76,25.78
SPIORX
  Top 0.254: U2.20 108.2,36.45 108.2,38.61 111.12,41.53 111.25,58.8 99.69,71.37 96.01,71.37 95.38,72.01 95.38,75.56 97.92,78.11 97.92,77.85 98.04,77.72 98.03,77.72 U$1.6
SPIOTX  (via drill 0.38)
  Top 0.254: v104.27,29.97 104.39,30.1 105.03,30.1 107.7,32.77 U2.21 107.7,38.99 110.62,41.91 110.74,56.52 108.46,58.67 108.46,59.18 99.57,68.83 95.63,68.83 94.74,69.72 94.74,77.28 U$1.5 | v106.43,25.53 107.82,25.53 109.09,24.26 110.79,24.26 U1.15
  Bottom 0.254: v104.27,29.97 104.27,27.69 v106.43,25.53
VIN+
  Top 0.28: U4.P$15 223.48,46.66 223.48,47.36 223.33,47.41 U4.P$16 223.48,47.41 224.48,47.41 | U4.P$13 224.03,45.02 224.23,45.01
  Top 0.305: 224.23,45.01 227.64,45.01 227.71,45.09
  Top 0.406: 224.48,47.41 227.16,47.41 228.09,46.48 228.09,45.47 227.71,45.09 227.58,44.96
  Top 0.61: L2.2 198.07,58.85 C10.1 200.15,59.03 | 200.15,59.03 C9.1 | 224.48,47.41 223.66,47.41 | 223.66,47.41 223.33,47.41 | 223.66,47.41 208.65,59.07 206.76,59.18 202.69,59.18 200.15,59.03
VIN-
  Top 0.305: U5.P$13 200.13,45.19 199.9,44.96 | U5.P$16 200.54,42.79 199.9,43.43 | U5.P$15 202.48,43.73 202.18,43.43 200.15,43.43 199.9,43.69
  Top 0.406: C11.1 200.15,52.1 200.15,52.07 199.38,51.3 C16.1 L1.2
  Top 0.61: 199.9,43.43 199.9,43.69 199.9,44.96 199.9,45.72 198.37,47.5 198.37,49.53 200.15,52.07
VS0  (via drill 0.38)
  Top 0.254: v24.89,13.72 v42.42,13.97 | v49.91,13.72 v66.04,13.72 | v74.68,13.72 88.9,13.72 v92.84,18.03 | v97.54,18.03 99.06,19.56 101.58,22.59 101.92,22.93 U1.4
  Bottom 0.254: J1.7 16.32,11.87 16.51,12.19 18.03,13.72 v24.89,13.72 | v42.42,13.97 v49.91,13.72 | v66.04,13.72 v74.68,13.72 | v92.84,18.03 v97.54,18.03
VS1  (via drill 0.38)  (1 unrouted)
  Top 0.254: J2.7 41.73,11.36 v42.55,12.95 | v49.91,12.7 v66.29,12.45 | v74.68,12.45 88.77,12.32 90.55,14.1 v90.81,14.1 | v99.19,14.61 99.06,18.16 101.85,21.08 101.85,21.34 v102.62,22.1 | U1.13 109.04,22.93 v108.97,22.86
  Bottom 0.254: v42.55,12.95 42.29,12.57 42.8,12.7 49.78,12.57 v49.91,12.7 | v66.29,12.45 v74.68,12.45 | v90.81,14.1 91.31,14.22 98.81,14.22 | 98.81,14.22 98.93,14.22 98.81,14.22 | 98.81,14.22 v99.19,14.61 | v102.62,22.1 107.95,22.1 108.71,22.86 | v108.97,22.86 108.46,22.86
VS2  (via drill 0.38)
  Top 0.254: J3.7 67.12,9.33 67.18,10.67 67.18,14.22 v67.18,14.99 | v74.8,14.86 88.27,14.86 90.68,17.27 v90.93,17.27 | v100.08,17.27 100.58,18.8 102.36,20.57 104.07,22.28 U1.5
  Bottom 0.254: v67.18,14.99 v74.8,14.86 | v90.93,17.27 v100.08,17.27
VS3  (via drill 0.38)
  Top 0.254: J4.7 92.53,11.36 v91.82,13.34 | v100.46,13.59 101.35,14.48 101.35,18.54 102.87,20.07 v103.38,20.57 | U1.12 109.66,22.28 v108.71,21.34
  Bottom 0.254: v91.82,13.34 100.2,13.34 v100.46,13.59 | v108.71,21.34 104.14,21.34 v103.38,20.57
VS4
  Top 0.254: U1.6 107.4,21.63 109.47,19.56 109.6,19.56
  Top 0.305: 109.47,19.56 114.17,19.56 116.84,22.23 118.24,22.23 118.87,21.72 118.87,20.83 119.25,20.32 119.76,20.32 120.02,20.19 120.02,19.43 118.87,18.29 116.97,18.29 116.08,17.4 116.08,10.74 J5.7
VS5  (via drill 0.38)
  Top 0.254: v124.97,21.34 130.88,21.34 J6.7 | U1.11 112.56,21.63 114.47,21.63 116.59,23.75 119.13,23.75 119.76,23.11 119.76,21.21 v119.63,21.08
  Bottom 0.254: v119.63,21.08 124.71,21.08 v124.97,21.34
VS6  (via drill 0.38)
  Top 0.254: J7.7 168.72,9.33 165.61,12.45 153.67,12.45 v153.54,12.45 | v125.73,22.1 134.37,22.23 143.51,12.57 v144.4,12.7 | U1.7 107.03,20.98 109.22,18.8 112.27,18.8 114.17,18.8 115.57,20.07 116.84,21.46 v117.73,21.46
  Bottom 0.254: v153.54,12.45 145.67,12.45 144.78,12.45 v144.4,12.7 | v117.73,21.46 119.38,22.1 v125.73,22.1
VS7  (via drill 0.38)
  Top 0.254: J8.7 194.12,9.58 192.28,11.43 177.8,11.43 v175.39,13.21 | v168.91,13.21 v152.4,13.21 | v124.97,22.86 134.49,22.99 v144.27,13.84 | U1.10 114.71,20.98 115.32,21.59 116.72,22.99 v118.49,22.99
  Bottom 0.254: v175.39,13.21 v168.91,13.21 | v152.4,13.21 144.91,13.34 v144.27,13.84 | v118.49,22.99 120.14,22.86 v124.97,22.86
VUSB  (1 unrouted)
  Top 0.61: C23.1 166.18,56.33 PS1.14
  Top 0.813: U$1.40 129.77,90.58 163.7,56.64